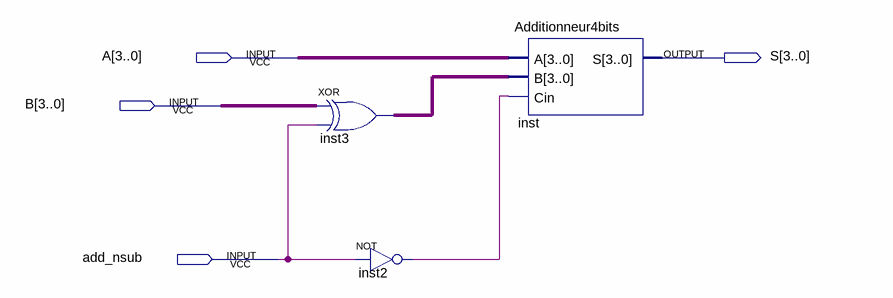
[diagram p0: schematic sheet]
// Quartus schematic AdditionneurSoustracteur4bits.bdf as structural Verilog: 3 symbols, 4 pins
module AdditionneurSoustracteur4bits (
  input  [3:0] A,
  input  [3:0] B,
  input  add_nsub,
  output [3:0] S
);

  wire inst2_out;
  wire [3:0] inst3_out;

  assign inst3_out = B ^ {4{add_nsub}};  // XOR inst3, 4 bits wide
  not inst2 (inst2_out, add_nsub);
  Additionneur4bits inst (.A(A), .B(inst3_out), .Cin(inst2_out), .S(S));
endmodule
